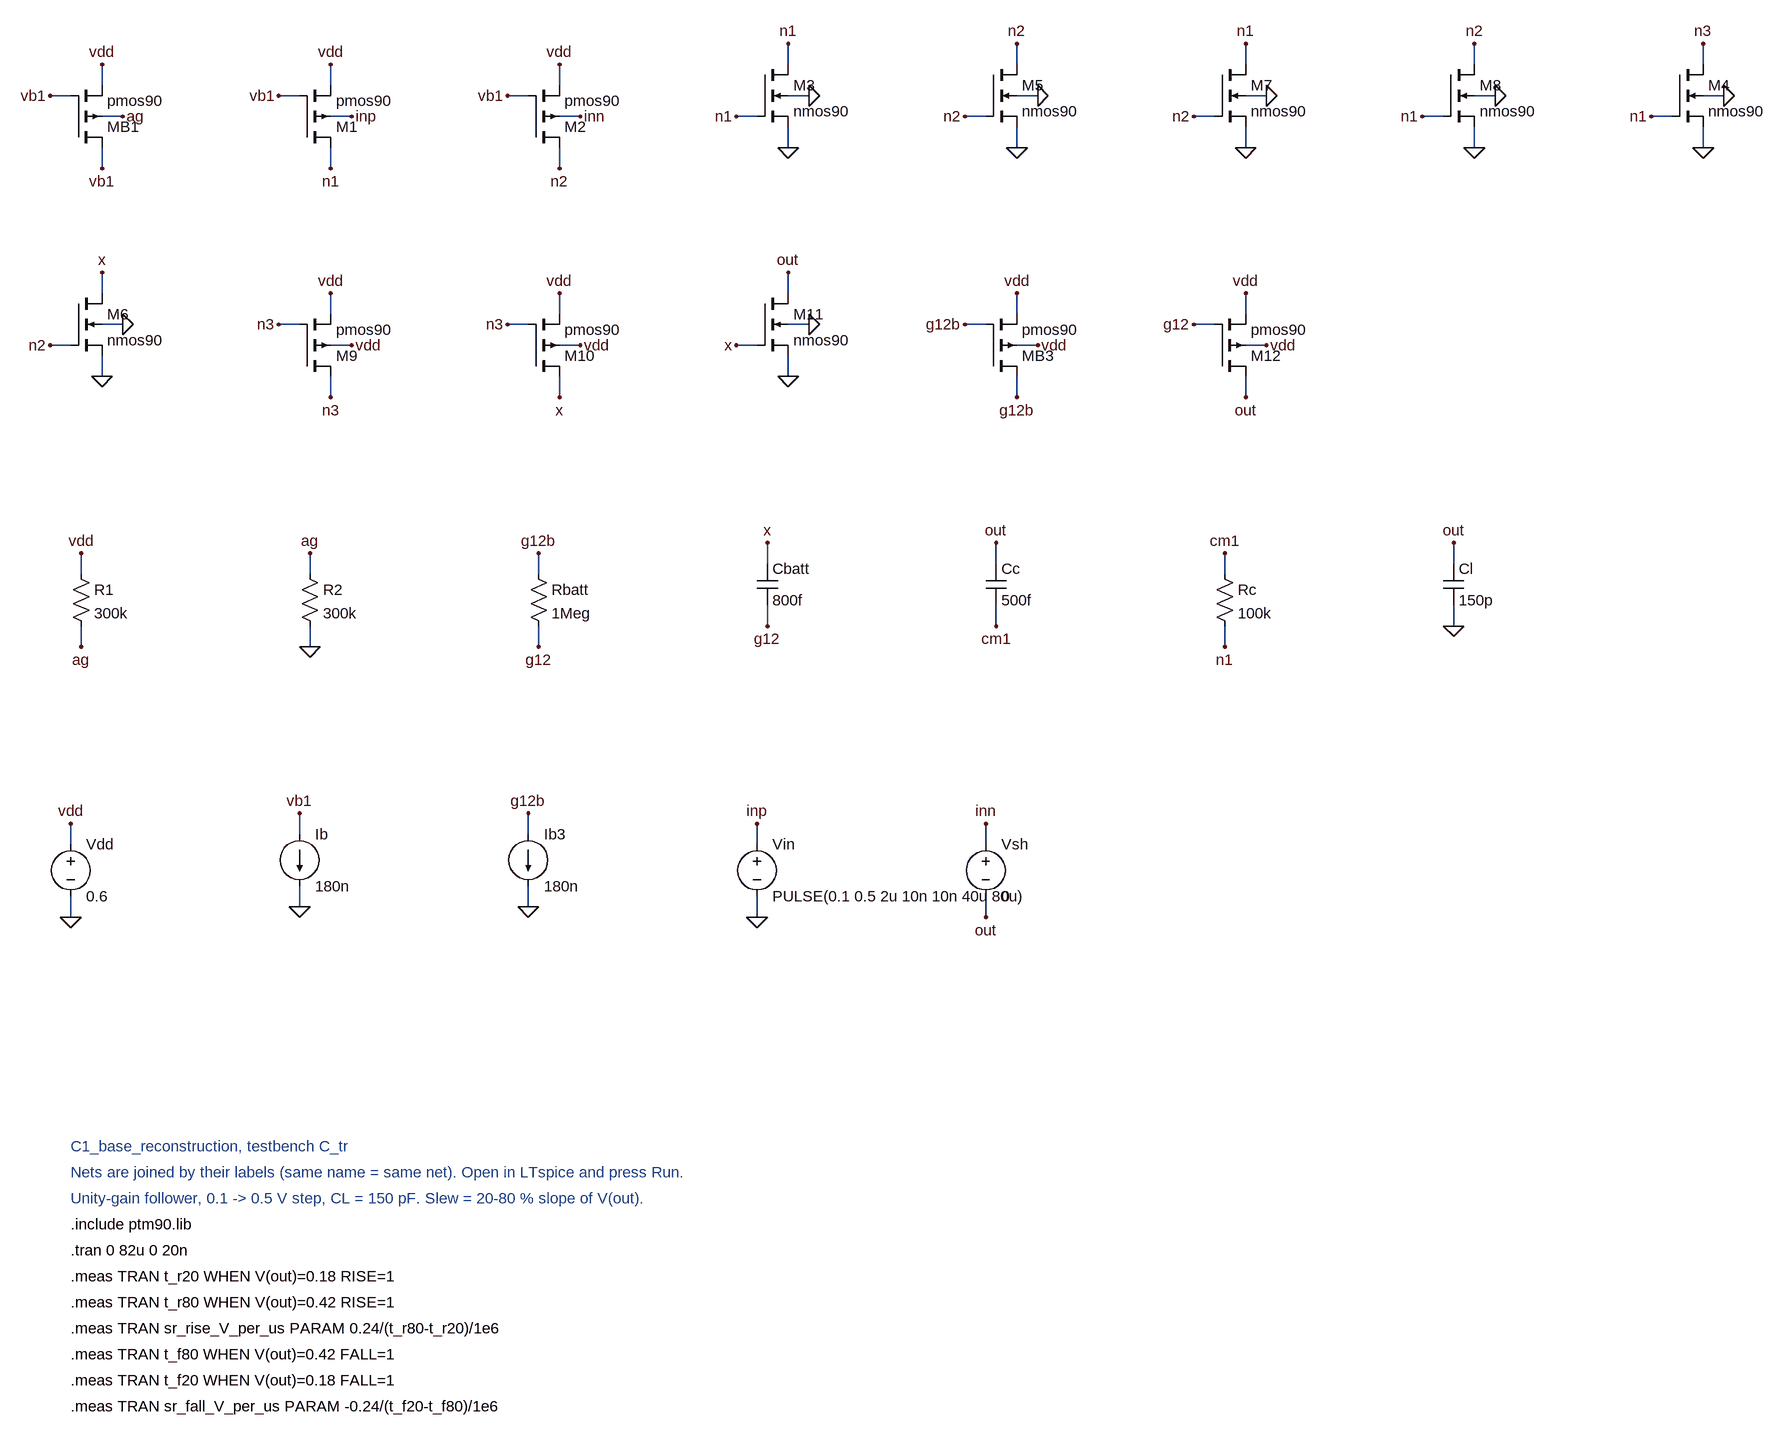
[diagram p0: schematic C1_base_reconstruction_C_tr.asc]
C1_base_reconstruction_C_tr.asc, the LTspice schematic file:
Version 4
SHEET 1 3200 2400
WIRE 48 128 48 160
WIRE 0 48 -32 48
WIRE 48 32 48 0
WIRE 48 80 80 80
WIRE 400 128 400 160
WIRE 352 48 320 48
WIRE 400 32 400 0
WIRE 400 80 432 80
WIRE 752 128 752 160
WIRE 704 48 672 48
WIRE 752 32 752 0
WIRE 752 80 784 80
WIRE 1104 0 1104 -32
WIRE 1056 80 1024 80
WIRE 1104 96 1104 128
WIRE 1104 48 1136 48
WIRE 1456 0 1456 -32
WIRE 1408 80 1376 80
WIRE 1456 96 1456 128
WIRE 1456 48 1488 48
WIRE 1808 0 1808 -32
WIRE 1760 80 1728 80
WIRE 1808 96 1808 128
WIRE 1808 48 1840 48
WIRE 2160 0 2160 -32
WIRE 2112 80 2080 80
WIRE 2160 96 2160 128
WIRE 2160 48 2192 48
WIRE 2512 0 2512 -32
WIRE 2464 80 2432 80
WIRE 2512 96 2512 128
WIRE 2512 48 2544 48
WIRE 48 352 48 320
WIRE 0 432 -32 432
WIRE 48 448 48 480
WIRE 48 400 80 400
WIRE 400 480 400 512
WIRE 352 400 320 400
WIRE 400 384 400 352
WIRE 400 432 432 432
WIRE 752 480 752 512
WIRE 704 400 672 400
WIRE 752 384 752 352
WIRE 752 432 784 432
WIRE 1104 352 1104 320
WIRE 1056 432 1024 432
WIRE 1104 448 1104 480
WIRE 1104 400 1136 400
WIRE 1456 480 1456 512
WIRE 1408 400 1376 400
WIRE 1456 384 1456 352
WIRE 1456 432 1488 432
WIRE 1808 480 1808 512
WIRE 1760 400 1728 400
WIRE 1808 384 1808 352
WIRE 1808 432 1840 432
WIRE 16 784 16 752
WIRE 16 864 16 896
WIRE 368 784 368 752
WIRE 368 864 368 896
WIRE 720 784 720 752
WIRE 720 864 720 896
WIRE 1072 768 1072 736
WIRE 1072 832 1072 864
WIRE 1424 768 1424 736
WIRE 1424 832 1424 864
WIRE 1776 784 1776 752
WIRE 1776 864 1776 896
WIRE 2128 768 2128 736
WIRE 2128 832 2128 864
WIRE 0 1200 0 1168
WIRE 0 1280 0 1312
WIRE 352 1184 352 1152
WIRE 352 1264 352 1296
WIRE 704 1184 704 1152
WIRE 704 1264 704 1296
WIRE 1056 1200 1056 1168
WIRE 1056 1280 1056 1312
WIRE 1408 1200 1408 1168
WIRE 1408 1280 1408 1312
FLAG 48 160 vb1
FLAG -32 48 vb1
FLAG 48 0 vdd
FLAG 80 80 ag
FLAG 400 160 n1
FLAG 320 48 vb1
FLAG 400 0 vdd
FLAG 432 80 inp
FLAG 752 160 n2
FLAG 672 48 vb1
FLAG 752 0 vdd
FLAG 784 80 inn
FLAG 1104 -32 n1
FLAG 1024 80 n1
FLAG 1104 128 0
FLAG 1136 48 0
FLAG 1456 -32 n2
FLAG 1376 80 n2
FLAG 1456 128 0
FLAG 1488 48 0
FLAG 1808 -32 n1
FLAG 1728 80 n2
FLAG 1808 128 0
FLAG 1840 48 0
FLAG 2160 -32 n2
FLAG 2080 80 n1
FLAG 2160 128 0
FLAG 2192 48 0
FLAG 2512 -32 n3
FLAG 2432 80 n1
FLAG 2512 128 0
FLAG 2544 48 0
FLAG 48 320 x
FLAG -32 432 n2
FLAG 48 480 0
FLAG 80 400 0
FLAG 400 512 n3
FLAG 320 400 n3
FLAG 400 352 vdd
FLAG 432 432 vdd
FLAG 752 512 x
FLAG 672 400 n3
FLAG 752 352 vdd
FLAG 784 432 vdd
FLAG 1104 320 out
FLAG 1024 432 x
FLAG 1104 480 0
FLAG 1136 400 0
FLAG 1456 512 g12b
FLAG 1376 400 g12b
FLAG 1456 352 vdd
FLAG 1488 432 vdd
FLAG 1808 512 out
FLAG 1728 400 g12
FLAG 1808 352 vdd
FLAG 1840 432 vdd
FLAG 16 752 vdd
FLAG 16 896 ag
FLAG 368 752 ag
FLAG 368 896 0
FLAG 720 752 g12b
FLAG 720 896 g12
FLAG 1072 736 x
FLAG 1072 864 g12
FLAG 1424 736 out
FLAG 1424 864 cm1
FLAG 1776 752 cm1
FLAG 1776 896 n1
FLAG 2128 736 out
FLAG 2128 864 0
FLAG 0 1168 vdd
FLAG 0 1312 0
FLAG 352 1152 vb1
FLAG 352 1296 0
FLAG 704 1152 g12b
FLAG 704 1296 0
FLAG 1056 1168 inp
FLAG 1056 1312 0
FLAG 1408 1168 inn
FLAG 1408 1312 out
SYMBOL pmos4 0 128 M180
SYMATTR InstName MB1
SYMATTR Value pmos90
SYMATTR Value2 W=3u L=180n m=2
SYMBOL pmos4 352 128 M180
SYMATTR InstName M1
SYMATTR Value pmos90
SYMATTR Value2 W=3u L=180n m=2
SYMBOL pmos4 704 128 M180
SYMATTR InstName M2
SYMATTR Value pmos90
SYMATTR Value2 W=3u L=180n m=2
SYMBOL nmos4 1056 0 R0
SYMATTR InstName M3
SYMATTR Value nmos90
SYMATTR Value2 W=6u L=180n
SYMBOL nmos4 1408 0 R0
SYMATTR InstName M5
SYMATTR Value nmos90
SYMATTR Value2 W=6u L=180n
SYMBOL nmos4 1760 0 R0
SYMATTR InstName M7
SYMATTR Value nmos90
SYMATTR Value2 W=5u L=180n
SYMBOL nmos4 2112 0 R0
SYMATTR InstName M8
SYMATTR Value nmos90
SYMATTR Value2 W=5u L=180n
SYMBOL nmos4 2464 0 R0
SYMATTR InstName M4
SYMATTR Value nmos90
SYMATTR Value2 W=6u L=180n m=15
SYMBOL nmos4 0 352 R0
SYMATTR InstName M6
SYMATTR Value nmos90
SYMATTR Value2 W=6u L=180n m=15
SYMBOL pmos4 352 480 M180
SYMATTR InstName M9
SYMATTR Value pmos90
SYMATTR Value2 W=6u L=180n m=4
SYMBOL pmos4 704 480 M180
SYMATTR InstName M10
SYMATTR Value pmos90
SYMATTR Value2 W=6u L=180n m=4
SYMBOL nmos4 1056 352 R0
SYMATTR InstName M11
SYMATTR Value nmos90
SYMATTR Value2 W=6u L=180n m=8
SYMBOL pmos4 1408 480 M180
SYMATTR InstName MB3
SYMATTR Value pmos90
SYMATTR Value2 W=6u L=180n
SYMBOL pmos4 1760 480 M180
SYMATTR InstName M12
SYMATTR Value pmos90
SYMATTR Value2 W=6u L=180n m=15
SYMBOL res 0 768 R0
SYMATTR InstName R1
SYMATTR Value 300k
SYMBOL res 352 768 R0
SYMATTR InstName R2
SYMATTR Value 300k
SYMBOL res 704 768 R0
SYMATTR InstName Rbatt
SYMATTR Value 1Meg
SYMBOL cap 1056 768 R0
SYMATTR InstName Cbatt
SYMATTR Value 800f
SYMBOL cap 1408 768 R0
SYMATTR InstName Cc
SYMATTR Value 500f
SYMBOL res 1760 768 R0
SYMATTR InstName Rc
SYMATTR Value 100k
SYMBOL cap 2112 768 R0
SYMATTR InstName Cl
SYMATTR Value 150p
SYMBOL voltage 0 1184 R0
SYMATTR InstName Vdd
SYMATTR Value 0.6
SYMBOL current 352 1184 R0
SYMATTR InstName Ib
SYMATTR Value 180n
SYMBOL current 704 1184 R0
SYMATTR InstName Ib3
SYMATTR Value 180n
SYMBOL voltage 1056 1184 R0
SYMATTR InstName Vin
SYMATTR Value PULSE(0.1 0.5 2u 10n 10n 40u 80u)
SYMBOL voltage 1408 1184 R0
SYMATTR InstName Vsh
SYMATTR Value 0
TEXT 0 1664 Left 2 ;C1_base_reconstruction, testbench C_tr
TEXT 0 1704 Left 2 ;Nets are joined by their labels (same name = same net). Open in LTspice and press Run.
TEXT 0 1744 Left 2 ;Unity-gain follower, 0.1 -> 0.5 V step, CL = 150 pF. Slew = 20-80 % slope of V(out).
TEXT 0 1784 Left 2 !.include ptm90.lib
TEXT 0 1824 Left 2 !.tran 0 82u 0 20n
TEXT 0 1864 Left 2 !.meas TRAN t_r20 WHEN V(out)=0.18 RISE=1
TEXT 0 1904 Left 2 !.meas TRAN t_r80 WHEN V(out)=0.42 RISE=1
TEXT 0 1944 Left 2 !.meas TRAN sr_rise_V_per_us PARAM 0.24/(t_r80-t_r20)/1e6
TEXT 0 1984 Left 2 !.meas TRAN t_f80 WHEN V(out)=0.42 FALL=1
TEXT 0 2024 Left 2 !.meas TRAN t_f20 WHEN V(out)=0.18 FALL=1
TEXT 0 2064 Left 2 !.meas TRAN sr_fall_V_per_us PARAM -0.24/(t_f20-t_f80)/1e6

The netlist it stands for:
* C1_base_reconstruction_C_tr.asc
MB1 vb1 vb1 vdd ag pmos90 W=3u L=180n m=2
M1 n1 vb1 vdd inp pmos90 W=3u L=180n m=2
M2 n2 vb1 vdd inn pmos90 W=3u L=180n m=2
M3 n1 n1 0 0 nmos90 W=6u L=180n
M5 n2 n2 0 0 nmos90 W=6u L=180n
M7 n1 n2 0 0 nmos90 W=5u L=180n
M8 n2 n1 0 0 nmos90 W=5u L=180n
M4 n3 n1 0 0 nmos90 W=6u L=180n m=15
M6 x n2 0 0 nmos90 W=6u L=180n m=15
M9 n3 n3 vdd vdd pmos90 W=6u L=180n m=4
M10 x n3 vdd vdd pmos90 W=6u L=180n m=4
M11 out x 0 0 nmos90 W=6u L=180n m=8
MB3 g12b g12b vdd vdd pmos90 W=6u L=180n
M12 out g12 vdd vdd pmos90 W=6u L=180n m=15
R1 vdd ag 300k
R2 ag 0 300k
Rbatt g12b g12 1Meg
Cbatt x g12 800f
Cc out cm1 500f
Rc cm1 n1 100k
Cl out 0 150p
Vdd vdd 0 0.6
Ib vb1 0 180n
Ib3 g12b 0 180n
Vin inp 0 PULSE(0.1 0.5 2u 10n 10n 40u 80u)
Vsh inn out 0
.model NMOS NMOS
.model PMOS PMOS
.lib standard.mos
* C1_base_reconstruction, testbench C_tr
* Nets are joined by their labels (same name = same net). Open in LTspice and press Run.
* Unity-gain follower, 0.1 -> 0.5 V step, CL = 150 pF. Slew = 20-80 % slope of V(out).
.include ptm90.lib
.tran 0 82u 0 20n
.meas TRAN t_r20 WHEN V(out)=0.18 RISE=1
.meas TRAN t_r80 WHEN V(out)=0.42 RISE=1
.meas TRAN sr_rise_V_per_us PARAM 0.24/(t_r80-t_r20)/1e6
.meas TRAN t_f80 WHEN V(out)=0.42 FALL=1
.meas TRAN t_f20 WHEN V(out)=0.18 FALL=1
.meas TRAN sr_fall_V_per_us PARAM -0.24/(t_f20-t_f80)/1e6
.backanno
.end